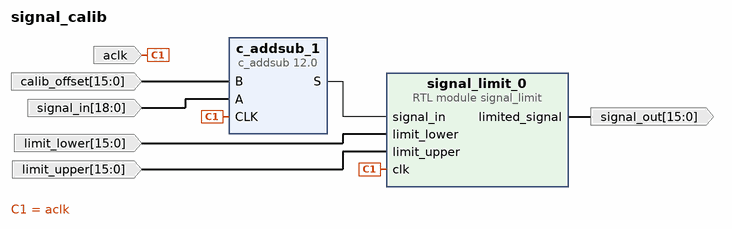
[diagram p0: block diagram of the top level]
# Vivado block design signal_calib, xc7z010clg400-1, Vivado 2021.2
create_bd_design signal_calib

create_bd_port -dir I -type clk aclk
set_property -dict {CONFIG.FREQ_HZ 125000000} [get_bd_ports aclk]
create_bd_port -dir I -from 15 -to 0 calib_offset
create_bd_port -dir I -from 15 -to 0 limit_lower
create_bd_port -dir I -from 15 -to 0 limit_upper
create_bd_port -dir I -from 18 -to 0 signal_in
create_bd_port -dir O -from 15 -to 0 signal_out

create_bd_cell -type ip -vlnv xilinx.com:ip:c_addsub:12.0 c_addsub_1
set_property -dict [list \
  CONFIG.A_Type Signed \
  CONFIG.A_Width 19 \
  CONFIG.B_Type Signed \
  CONFIG.B_Value 0000000000000000 \
  CONFIG.B_Width 16 \
  CONFIG.CE false \
  CONFIG.Implementation DSP48 \
  CONFIG.Latency 1 \
  CONFIG.Out_Width 19 \
] [get_bd_cells c_addsub_1]
create_bd_cell -type module -reference signal_limit signal_limit_0

# ---- connections ----

connect_bd_net [get_bd_ports aclk] [get_bd_pins c_addsub_1/CLK] [get_bd_pins signal_limit_0/clk]
connect_bd_net [get_bd_pins c_addsub_1/S] [get_bd_pins signal_limit_0/signal_in]
connect_bd_net [get_bd_ports calib_offset] [get_bd_pins c_addsub_1/B]
connect_bd_net [get_bd_ports limit_lower] [get_bd_pins signal_limit_0/limit_lower]
connect_bd_net [get_bd_ports limit_upper] [get_bd_pins signal_limit_0/limit_upper]
connect_bd_net [get_bd_ports signal_in] [get_bd_pins c_addsub_1/A]
connect_bd_net [get_bd_pins signal_limit_0/limited_signal] [get_bd_ports signal_out]

validate_bd_design
save_bd_design
